# Altium schematic sheet Control block.SchDoc
size A3; SheetNumber: 1; SheetTotal: 3
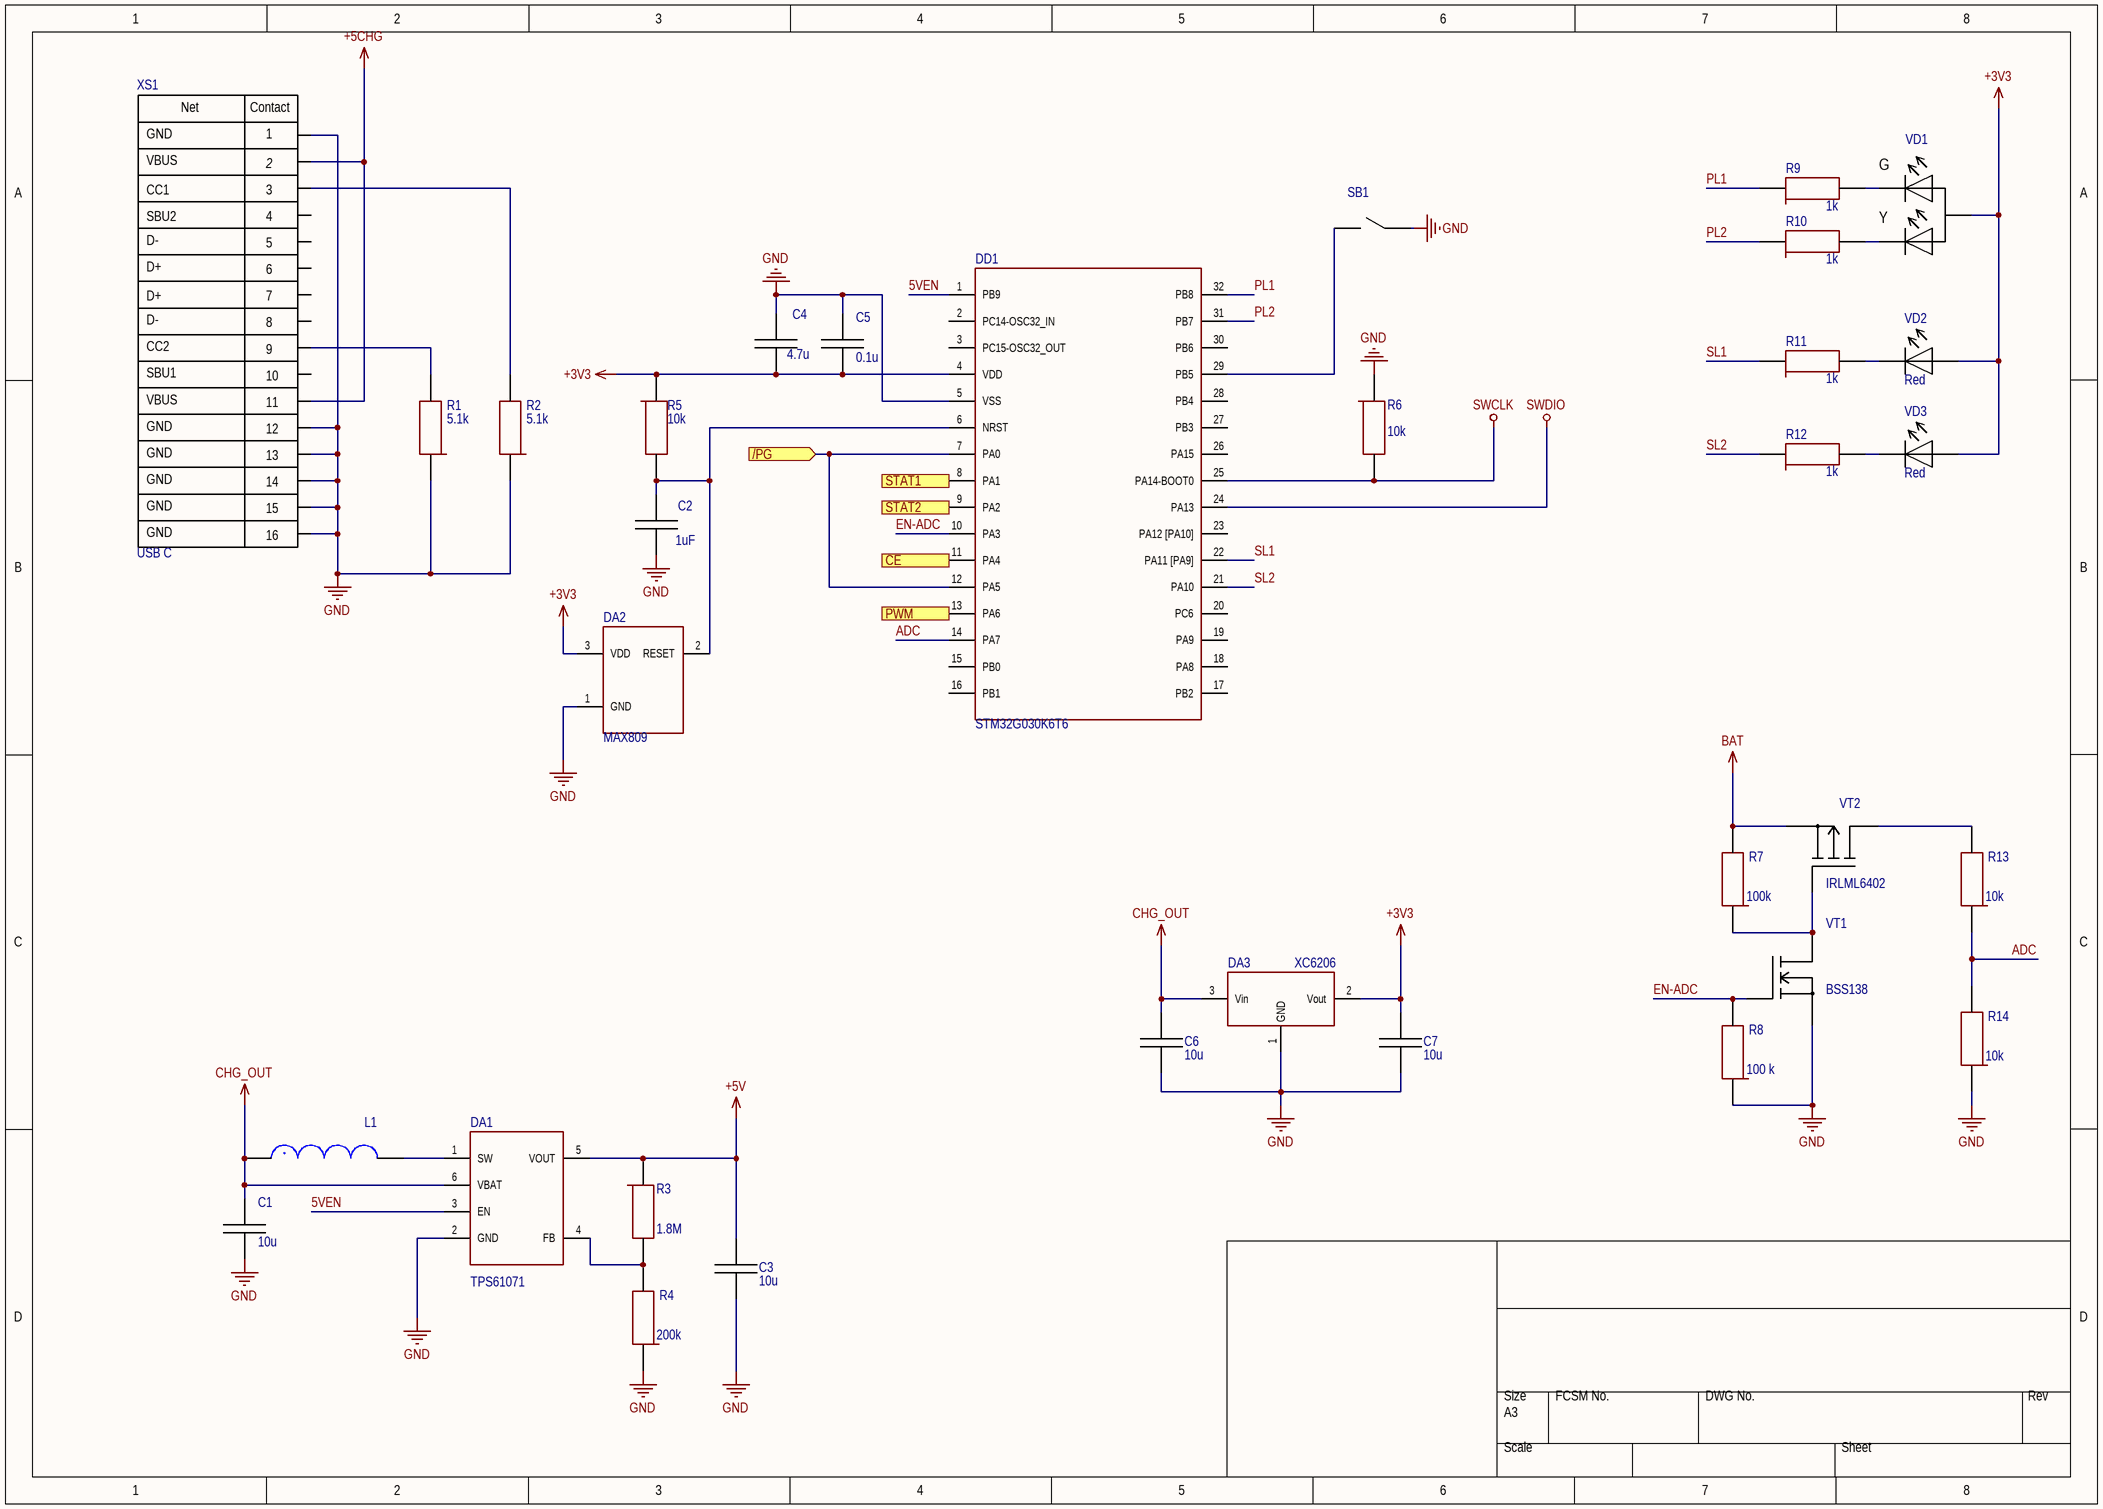
[diagram p0: Control block.SchDoc]

## Parts
C1  10u  [C0402]
C2  1uF  [C0402]
C3  10u  [C0402]
C4  4.7u  [C0402]
C5  0.1u  [C0402]
C6  10u  [C0402]
C7  10u  [C0402]
DA1  TPS61071  [SOT23-6]
DA2  MAX809  [SOT23-3]
DA3  XC6206  [SOT23-3]
DD1  STM32G030K6T6  [LQFP32]
L1  Inductor  [LQH32CN100K23]  (value not drawn)
R1  5.1k  [0603]
R2  5.1k  [0603]
R3  1.8M  [0402]
R4  200k  [0402]
R5  10k  [0402]
R6  10k  [0402]
R7  100k  [0402]
R8  100 k  [0402]
R9  1k  [0402]
R10  1k  [0402]
R11  1k  [0402]
R12  1k  [0402]
R13  10k  [0402]
R14  10k  [0402]
SB1  Button  [KLS7-TS3606]  (value not drawn)
VD1  LED Duble  [APBA3010SYKCGKC-GX]  (value not drawn)
VD2  Red  [KPA-3010SGC]
VD3  Red  [KPA-3010SGC]
VT1  BSS138  [SOT23-3]
VT2  IRLML6402  [SOT23-3]
XS1  USB C  [USB C 16]

## Ports
/PG (in, see charge_block[4B]), CE (out, see charge_block[2C]), PWM (out, see LEDS[3A]), STAT1 (in, see charge_block[1B]), STAT2 (in, see charge_block[1B])

## Nets
+3V3: C4.1 C5.1 C7.2 DA2.3(VDD) DA3.2(Vout) DD1.4(VDD) R5.1 VD1.1(Anode) VD2.2(Anode) VD3.2(Anode)
+5CHG: XS1.2(VBUS) XS1.11(VBUS)
+5V: C3.2 DA1.5(VOUT) R3.1
BAT: R7.2 VT2.2(Source)
CHG_OUT: C1.2 C6.2 DA1.6(VBAT) DA3.3(Vin) L1.1
GND: C1.1 C2.1 C3.1 C4.2 C5.2 C6.1 C7.1 DA1.2(GND) DA2.1(GND) DA3.1(GND) DD1.5(VSS) R1.1 R2.1 R4.1 R6.1 R8.1 R14.1 SB1.1 VT1.2(Source) XS1.1(GND) XS1.12(GND) XS1.13(GND) XS1.14(GND) XS1.15(GND) XS1.16(GND)
SWCLK: DD1.25(PA14-BOOT0) R6.2
SWDIO: DD1.24(PA13)
5VEN: DA1.3(EN) DD1.1(PB9)
/PG: DD1.7(PA0) DD1.12(PA5) ; port /PG
ADC: DD1.14(PA7) R13.1 R14.2
CE: DD1.11(PA4) ; port CE
EN-ADC: DD1.10(PA3) R8.2 VT1.1(Gate)
PL1: DD1.32(PB8) R9.1
PL2: DD1.31(PB7) R10.1
PWM: DD1.13(PA6) ; port PWM
SL1: DD1.22(PA11_[PA9]) R11.1
SL2: DD1.21(PA10) R12.1
STAT1: DD1.8(PA1) ; port STAT1
STAT2: DD1.9(PA2) ; port STAT2
NetC2_2: C2.2 DA2.2(RESET) DD1.6(NRST) R5.2
NetDA1_1: DA1.1(SW) L1.2
NetDA1_4: DA1.4(FB) R3.2 R4.2
NetDD1_29: DD1.29(PB5) SB1.2
NetR1_2: R1.2 XS1.9(CC2)
NetR2_2: R2.2 XS1.3(CC1)
NetR7_1: R7.1 VT1.3(Drain) VT2.1(Gate)
NetR9_2: R9.2 VD1.3(Green)
NetR10_2: R10.2 VD1.2(Yellow)
NetR11_2: R11.2 VD2.1(Cathode)
NetR12_2: R12.2 VD3.1(Cathode)
NetR13_2: R13.2 VT2.3(Drain)

Not connected (* = marked no-connect by the designer): DD1 2(PC14-OSC32_IN) 3(PC15-OSC32_OUT) 15(PB0) 16(PB1) 17(PB2) 18(PA8) 19(PA9) 20(PC6) 23(PA12_[PA10]) 26(PA15) 27(PB3) 28(PB4) 30(PB6); XS1 4(SBU2) 5(D-) 6(D+) 7(D+) 8(D-) 10(SBU1)

## Notes on the sheet
- (in symbol LED Duble) G; Y
- (in symbol USB C 16) Net; Contaсt

## Library data of the parts
C1-C7 = Capacitor
DA1 = TPS6107x: Efficient Synchronous Boost Converter
DA3 = LDO XC6206
R1-R14 = Resistor
VD2 VD3 = LED
VT1 = N-MOSFET
VT2 = P-MOSFET
XS1 = USB C 16